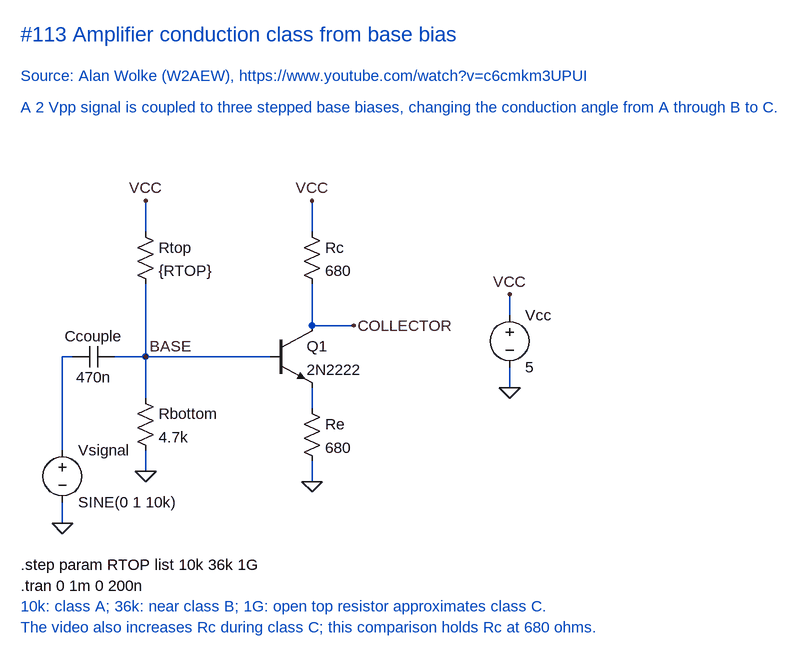
[diagram p0: schematic Amplifier classes A B C.asc]
Amplifier classes A B C.asc, the LTspice schematic file:
Version 4.1
SHEET 1 1100 980
WIRE 480 336 480 288
WIRE 480 480 480 416
WIRE 544 480 480 480
WIRE 224 336 224 288
WIRE 224 528 224 416
WIRE 416 528 224 528
WIRE 224 592 224 528
WIRE 224 704 224 672
WIRE 480 608 480 576
WIRE 480 720 480 688
WIRE 96 672 96 528
WIRE 96 784 96 752
WIRE 112 528 96 528
WIRE 224 528 176 528
WIRE 784 464 784 432
WIRE 784 576 784 544
FLAG 96 784 0
FLAG 224 288 VCC
FLAG 224 704 0
FLAG 480 288 VCC
FLAG 480 720 0
FLAG 784 432 VCC
FLAG 784 576 0
FLAG 544 480 COLLECTOR
FLAG 224 528 BASE
SYMBOL voltage 96 656 R0
SYMATTR InstName Vsignal
SYMATTR Value SINE(0 1 10k)
SYMBOL voltage 784 448 R0
SYMATTR InstName Vcc
SYMATTR Value 5
SYMBOL cap 176 512 R90
WINDOW 0 0 32 VBottom 2
WINDOW 3 32 32 VTop 2
SYMATTR InstName Ccouple
SYMATTR Value 470n
SYMBOL res 208 320 R0
SYMATTR InstName Rtop
SYMATTR Value {RTOP}
SYMBOL res 208 576 R0
SYMATTR InstName Rbottom
SYMATTR Value 4.7k
SYMBOL res 464 320 R0
SYMATTR InstName Rc
SYMATTR Value 680
SYMBOL npn 416 480 R0
SYMATTR InstName Q1
SYMATTR Value 2N2222
SYMBOL res 464 592 R0
SYMATTR InstName Re
SYMATTR Value 680
TEXT 32 32 Left 3 ;#113 Amplifier conduction class from base bias
TEXT 32 96 Left 2 ;Source: Alan Wolke (W2AEW), https://www.youtube.com/watch?v=c6cmkm3UPUI
TEXT 32 144 Left 2 ;A 2 Vpp signal is coupled to three stepped base biases, changing the conduction angle from A through B to C.
TEXT 32 848 Left 2 !.step param RTOP list 10k 36k 1G
TEXT 32 880 Left 2 !.tran 0 1m 0 200n
TEXT 32 912 Left 2 ;10k: class A; 36k: near class B; 1G: open top resistor approximates class C.
TEXT 32 944 Left 2 ;The video also increases Rc during class C; this comparison holds Rc at 680 ohms.

The netlist it stands for:
* Amplifier classes A B C.asc
Vsignal N002 0 SINE(0 1 10k)
Vcc VCC 0 5
Ccouple BASE N002 470n
Rtop VCC BASE {RTOP}
Rbottom BASE 0 4.7k
Rc VCC COLLECTOR 680
Q1 COLLECTOR BASE N001 0 2N2222
Re N001 0 680
.model NPN NPN
.model PNP PNP
.lib standard.bjt
* #113 Amplifier conduction class from base bias
* Source: Alan Wolke (W2AEW), https://www.youtube.com/watch?v=c6cmkm3UPUI
* A 2 Vpp signal is coupled to three stepped base biases, changing the conduction angle from A through B to C.
.step param RTOP list 10k 36k 1G
.tran 0 1m 0 200n
* 10k: class A; 36k: near class B; 1G: open top resistor approximates class C.
* The video also increases Rc during class C; this comparison holds Rc at 680 ohms.
.backanno
.end